# Altium schematic sheet I2C_Communication.SchDoc
size A4; SheetNumber: 3; SheetTotal: 5
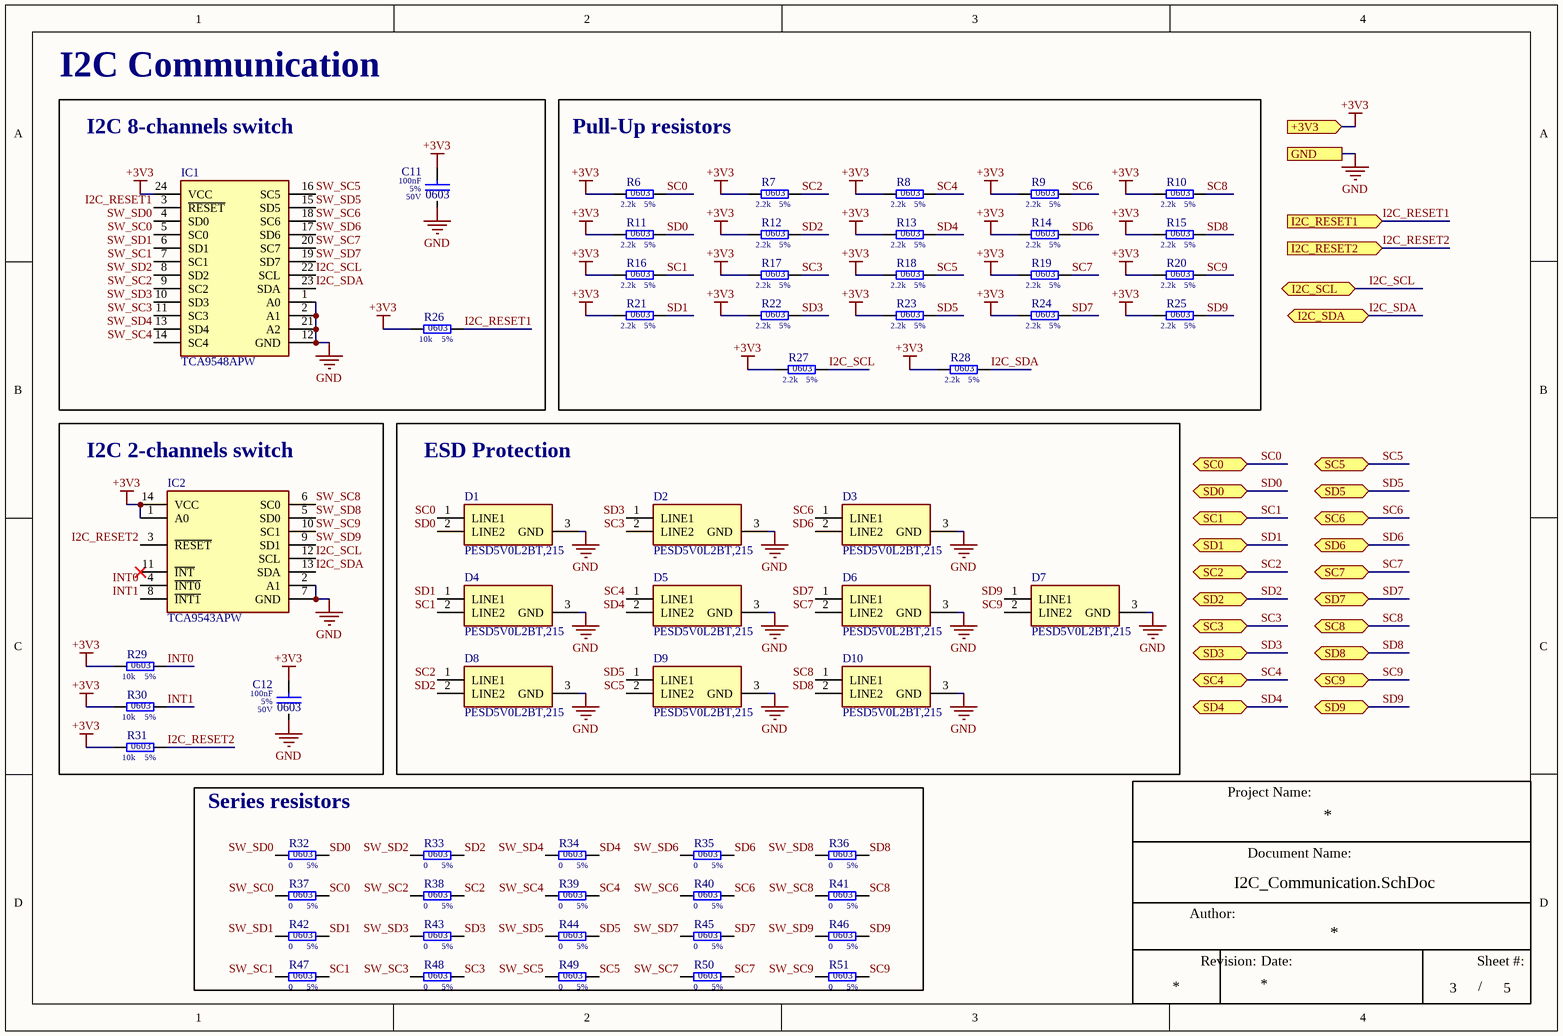
[diagram p0: I2C_Communication.SchDoc]

## Parts
C11  value 100nF  Tolerance: 5%  Voltage Rating: 50V  Case/Package: 0603  [0603_Capacitor]  (hidden comment: C_100n_50V_0603_5)
C12  value 100nF  Tolerance: 5%  Voltage Rating: 50V  Case/Package: 0603  [0603_Capacitor]  (hidden comment: C_100n_50V_0603_5)
D1  PESD5V0L2BT,215  [SOT95P230X110-3N]
D2  PESD5V0L2BT,215  [SOT95P230X110-3N]
D3  PESD5V0L2BT,215  [SOT95P230X110-3N]
D4  PESD5V0L2BT,215  [SOT95P230X110-3N]
D5  PESD5V0L2BT,215  [SOT95P230X110-3N]
D6  PESD5V0L2BT,215  [SOT95P230X110-3N]
D7  PESD5V0L2BT,215  [SOT95P230X110-3N]
D8  PESD5V0L2BT,215  [SOT95P230X110-3N]
D9  PESD5V0L2BT,215  [SOT95P230X110-3N]
D10  PESD5V0L2BT,215  [SOT95P230X110-3N]
IC1  TCA9548APW  [SOP65P640X120-24N]
IC2  TCA9543APW  [SOP65P640X120-14N]
R6  Tolerance: 5%  Resistance: 2.2k  Case/Package: 0603  [0603_Resistor]  (hidden comment: R_2.2k_0603_5)
R7  Tolerance: 5%  Resistance: 2.2k  Case/Package: 0603  [0603_Resistor]  (hidden comment: R_2.2k_0603_5)
R8  Tolerance: 5%  Resistance: 2.2k  Case/Package: 0603  [0603_Resistor]  (hidden comment: R_2.2k_0603_5)
R9  Tolerance: 5%  Resistance: 2.2k  Case/Package: 0603  [0603_Resistor]  (hidden comment: R_2.2k_0603_5)
R10  Tolerance: 5%  Resistance: 2.2k  Case/Package: 0603  [0603_Resistor]  (hidden comment: R_2.2k_0603_5)
R11  Tolerance: 5%  Resistance: 2.2k  Case/Package: 0603  [0603_Resistor]  (hidden comment: R_2.2k_0603_5)
R12  Tolerance: 5%  Resistance: 2.2k  Case/Package: 0603  [0603_Resistor]  (hidden comment: R_2.2k_0603_5)
R13  Tolerance: 5%  Resistance: 2.2k  Case/Package: 0603  [0603_Resistor]  (hidden comment: R_2.2k_0603_5)
R14  Tolerance: 5%  Resistance: 2.2k  Case/Package: 0603  [0603_Resistor]  (hidden comment: R_2.2k_0603_5)
R15  Tolerance: 5%  Resistance: 2.2k  Case/Package: 0603  [0603_Resistor]  (hidden comment: R_2.2k_0603_5)
R16  Tolerance: 5%  Resistance: 2.2k  Case/Package: 0603  [0603_Resistor]  (hidden comment: R_2.2k_0603_5)
R17  Tolerance: 5%  Resistance: 2.2k  Case/Package: 0603  [0603_Resistor]  (hidden comment: R_2.2k_0603_5)
R18  Tolerance: 5%  Resistance: 2.2k  Case/Package: 0603  [0603_Resistor]  (hidden comment: R_2.2k_0603_5)
R19  Tolerance: 5%  Resistance: 2.2k  Case/Package: 0603  [0603_Resistor]  (hidden comment: R_2.2k_0603_5)
R20  Tolerance: 5%  Resistance: 2.2k  Case/Package: 0603  [0603_Resistor]  (hidden comment: R_2.2k_0603_5)
R21  Tolerance: 5%  Resistance: 2.2k  Case/Package: 0603  [0603_Resistor]  (hidden comment: R_2.2k_0603_5)
R22  Tolerance: 5%  Resistance: 2.2k  Case/Package: 0603  [0603_Resistor]  (hidden comment: R_2.2k_0603_5)
R23  Tolerance: 5%  Resistance: 2.2k  Case/Package: 0603  [0603_Resistor]  (hidden comment: R_2.2k_0603_5)
R24  Tolerance: 5%  Resistance: 2.2k  Case/Package: 0603  [0603_Resistor]  (hidden comment: R_2.2k_0603_5)
R25  Tolerance: 5%  Resistance: 2.2k  Case/Package: 0603  [0603_Resistor]  (hidden comment: R_2.2k_0603_5)
R26  Tolerance: 5%  Resistance: 10k  Case/Package: 0603  [0603_Resistor]  (hidden comment: R_10k_0603_5)
R27  Tolerance: 5%  Resistance: 2.2k  Case/Package: 0603  [0603_Resistor]  (hidden comment: R_2.2k_0603_5)
R28  Tolerance: 5%  Resistance: 2.2k  Case/Package: 0603  [0603_Resistor]  (hidden comment: R_2.2k_0603_5)
R29  Tolerance: 5%  Resistance: 10k  Case/Package: 0603  [0603_Resistor]  (hidden comment: R_10k_0603_5)
R30  Tolerance: 5%  Resistance: 10k  Case/Package: 0603  [0603_Resistor]  (hidden comment: R_10k_0603_5)
R31  Tolerance: 5%  Resistance: 10k  Case/Package: 0603  [0603_Resistor]  (hidden comment: R_10k_0603_5)
R32  Tolerance: 5%  Resistance: 0  Case/Package: 0603  [0603_Resistor]  (hidden comment: R_0_0603_5)
R33  Tolerance: 5%  Resistance: 0  Case/Package: 0603  [0603_Resistor]  (hidden comment: R_0_0603_5)
R34  Tolerance: 5%  Resistance: 0  Case/Package: 0603  [0603_Resistor]  (hidden comment: R_0_0603_5)
R35  Tolerance: 5%  Resistance: 0  Case/Package: 0603  [0603_Resistor]  (hidden comment: R_0_0603_5)
R36  Tolerance: 5%  Resistance: 0  Case/Package: 0603  [0603_Resistor]  (hidden comment: R_0_0603_5)
R37  Tolerance: 5%  Resistance: 0  Case/Package: 0603  [0603_Resistor]  (hidden comment: R_0_0603_5)
R38  Tolerance: 5%  Resistance: 0  Case/Package: 0603  [0603_Resistor]  (hidden comment: R_0_0603_5)
R39  Tolerance: 5%  Resistance: 0  Case/Package: 0603  [0603_Resistor]  (hidden comment: R_0_0603_5)
R40  Tolerance: 5%  Resistance: 0  Case/Package: 0603  [0603_Resistor]  (hidden comment: R_0_0603_5)
R41  Tolerance: 5%  Resistance: 0  Case/Package: 0603  [0603_Resistor]  (hidden comment: R_0_0603_5)
R42  Tolerance: 5%  Resistance: 0  Case/Package: 0603  [0603_Resistor]  (hidden comment: R_0_0603_5)
R43  Tolerance: 5%  Resistance: 0  Case/Package: 0603  [0603_Resistor]  (hidden comment: R_0_0603_5)
R44  Tolerance: 5%  Resistance: 0  Case/Package: 0603  [0603_Resistor]  (hidden comment: R_0_0603_5)
R45  Tolerance: 5%  Resistance: 0  Case/Package: 0603  [0603_Resistor]  (hidden comment: R_0_0603_5)
R46  Tolerance: 5%  Resistance: 0  Case/Package: 0603  [0603_Resistor]  (hidden comment: R_0_0603_5)
R47  Tolerance: 5%  Resistance: 0  Case/Package: 0603  [0603_Resistor]  (hidden comment: R_0_0603_5)
R48  Tolerance: 5%  Resistance: 0  Case/Package: 0603  [0603_Resistor]  (hidden comment: R_0_0603_5)
R49  Tolerance: 5%  Resistance: 0  Case/Package: 0603  [0603_Resistor]  (hidden comment: R_0_0603_5)
R50  Tolerance: 5%  Resistance: 0  Case/Package: 0603  [0603_Resistor]  (hidden comment: R_0_0603_5)
R51  Tolerance: 5%  Resistance: 0  Case/Package: 0603  [0603_Resistor]  (hidden comment: R_0_0603_5)

## Blocks framed on the sheet
I2C Communication: C11 IC1 R26
Pull-Up resistors: R6-R25 R27 R28
I2C 2-channels switch: C12 IC2 R29-R31
ESD Protection: D1-D10
Series resistors: R32-R51

## Ports
+3V3 (in), GND, I2C_RESET1 (in), I2C_RESET2 (in), I2C_SCL (bidir), I2C_SDA (bidir), SC0 (bidir), SC1 (bidir), SC2 (bidir), SC3 (bidir), SC4 (bidir), SC5 (bidir), SC6 (bidir), SC7 (bidir), SC8 (bidir), SC9 (bidir), SD0 (bidir), SD1 (bidir), SD2 (bidir), SD3 (bidir), SD4 (bidir), SD5 (bidir), SD6 (bidir), SD7 (bidir), SD8 (bidir), SD9 (bidir)

## Nets
+3V3: C11.1 C12.1 IC1.24(VCC) IC2.1(A0) IC2.14(VCC) R6.1 R7.1 R8.1 R9.1 R10.1 R11.1 R12.1 R13.1 R14.1 R15.1 R16.1 R17.1 R18.1 R19.1 R20.1 R21.1 R22.1 R23.1 R24.1 R25.1 R26.1 R27.1 R28.1 R29.1 R30.1 R31.1 ; port +3V3
GND: C11.2 C12.2 D1.3(GND) D2.3(GND) D3.3(GND) D4.3(GND) D5.3(GND) D6.3(GND) D7.3(GND) D8.3(GND) D9.3(GND) D10.3(GND) IC1.1(A0) IC1.2(A1) IC1.12(GND) IC1.21(A2) IC2.2(A1) IC2.7(GND) ; port GND
I2C_RESET1: IC1.3(~{RESET}) R26.2 ; port I2C_RESET1
I2C_RESET2: IC2.3(~{RESET}) R31.2 ; port I2C_RESET2
I2C_SCL: IC1.22(SCL) IC2.12(SCL) R27.2 ; port I2C_SCL
I2C_SDA: IC1.23(SDA) IC2.13(SDA) R28.2 ; port I2C_SDA
INT0: IC2.4(~{INT0}) R29.2
INT1: IC2.8(~{INT1}) R30.2
SC0: D1.1(LINE1) R6.2 R37.2 ; port SC0
SC1: D4.2(LINE2) R16.2 R47.2 ; port SC1
SC2: D8.1(LINE1) R7.2 R38.2 ; port SC2
SC3: D2.2(LINE2) R17.2 R48.2 ; port SC3
SC4: D5.1(LINE1) R8.2 R39.2 ; port SC4
SC5: D9.2(LINE2) R18.2 R49.2 ; port SC5
SC6: D3.1(LINE1) R9.2 R40.2 ; port SC6
SC7: D6.2(LINE2) R19.2 R50.2 ; port SC7
SC8: D10.1(LINE1) R10.2 R41.2 ; port SC8
SC9: D7.2(LINE2) R20.2 R51.2 ; port SC9
SD0: D1.2(LINE2) R11.2 R32.2 ; port SD0
SD1: D4.1(LINE1) R21.2 R42.2 ; port SD1
SD2: D8.2(LINE2) R12.2 R33.2 ; port SD2
SD3: D2.1(LINE1) R22.2 R43.2 ; port SD3
SD4: D5.2(LINE2) R13.2 R34.2 ; port SD4
SD5: D9.1(LINE1) R23.2 R44.2 ; port SD5
SD6: D3.2(LINE2) R14.2 R35.2 ; port SD6
SD7: D6.1(LINE1) R24.2 R45.2 ; port SD7
SD8: D10.2(LINE2) R15.2 R36.2 ; port SD8
SD9: D7.1(LINE1) R25.2 R46.2 ; port SD9
SW_SC0: IC1.5(SC0) R37.1
SW_SC1: IC1.7(SC1) R47.1
SW_SC2: IC1.9(SC2) R38.1
SW_SC3: IC1.11(SC3) R48.1
SW_SC4: IC1.14(SC4) R39.1
SW_SC5: IC1.16(SC5) R49.1
SW_SC6: IC1.18(SC6) R40.1
SW_SC7: IC1.20(SC7) R50.1
SW_SC8: IC2.6(SC0) R41.1
SW_SC9: IC2.10(SC1) R51.1
SW_SD0: IC1.4(SD0) R32.1
SW_SD1: IC1.6(SD1) R42.1
SW_SD2: IC1.8(SD2) R33.1
SW_SD3: IC1.10(SD3) R43.1
SW_SD4: IC1.13(SD4) R34.1
SW_SD5: IC1.15(SD5) R44.1
SW_SD6: IC1.17(SD6) R35.1
SW_SD7: IC1.19(SD7) R45.1
SW_SD8: IC2.5(SD0) R36.1
SW_SD9: IC2.9(SD1) R46.1

Not connected (* = marked no-connect by the designer): IC2 11(~{INT})*

## Notes on the sheet
- I2C 8-channels switch
- Project Name:
- Author:
- Document Name:
- Revision:
- Date:
- Sheet #:
- /

## Library data of the parts
C11 C12 = CMP-001-00008-27: Capacitor Type: Ceramic; Revision Num.: 1; HelpURL: https://www.tme.eu/Document/78f46414e6dac38b7cca12338ea208b0/X7RDielectric.pdf; Mounting Technology: SMT
D1-D10 = PESD5V0L2BT,215: Diode ESD (Bi-directional); Manufacturer_Name: Nexperia; Datasheet Link: https://assets.nexperia.com/documents/data-sheet/PESDXL2BT_SER.pdf; Height: 1.1mm; Manufacturer_Part_Number: PESD5V0L2BT,215; Mouser Part Number: 771-PESD5V0L2BT-T/R; Mouser Price/Stock: https://www.mouser.co.uk/ProductDetail/Nexperia/PESD5V0L2BT215?qs=LOCUfHb8d9sw%252B%2FcZzpNtzw%3D%3D; Arrow Part Number: PESD5V0L2BT,215; Arrow Price/Stock: https://www.arrow.com/en/products/pesd5v0l2bt215/nexperia?utm_currency=USD&region=nac
IC1 = TCA9548APW: Integrated Circuit; Manufacturer_Name: Texas Instruments; Datasheet Link: http://www.ti.com/lit/ds/symlink/tca9548a.pdf; Height: 1.2mm; Manufacturer_Part_Number: TCA9548APW
IC2 = TCA9543APW: Integrated Circuit; Manufacturer_Name: Texas Instruments; Datasheet Link: https://www.ti.com/lit/ds/symlink/tca9543a.pdf?ts=1706191605881&ref_url=https%253A%252F%252Fwww.ti.com%252Fproduct%252FTCA9543A%252Fpart-details%252FTCA9543APWR; Height: 1.2mm; Manufacturer_Part_Number: TCA9543APW
R6-R25 R27 R28 = CMP-009-00054-14: Revision Num.: 1; Voltage Rating: 50V; Power: 100mW; Mounting Technology: SMT; HelpURL: https://www.mouser.pl/datasheet/2/315/AOA0000C334-1314047.pdf
R26 R29-R31 = CMP-009-00002-21: Power: 100mW; Revision Num.: 1; Voltage Rating: 50V; Mounting Technology: SMT; HelpURL: https://www.tme.eu/Document/d2a72e545e5c8eb7bf2a04fa97535928/rc0603yageo.pdf
R32-R51 = CMP-009-00016-20: Power: 100mW; Revision Num.: 1; Voltage Rating: 50V; Mounting Technology: SMT; HelpURL: https://www.tme.eu/Document/c283990e907c122bb808207d1578ac7f/POWER_RATING-DTE.pdf